# Altium schematic sheet Power_Section_SMPS.SchDoc
size A4; DocumentNumber: 3; SheetNumber: 3; SheetTotal: 8
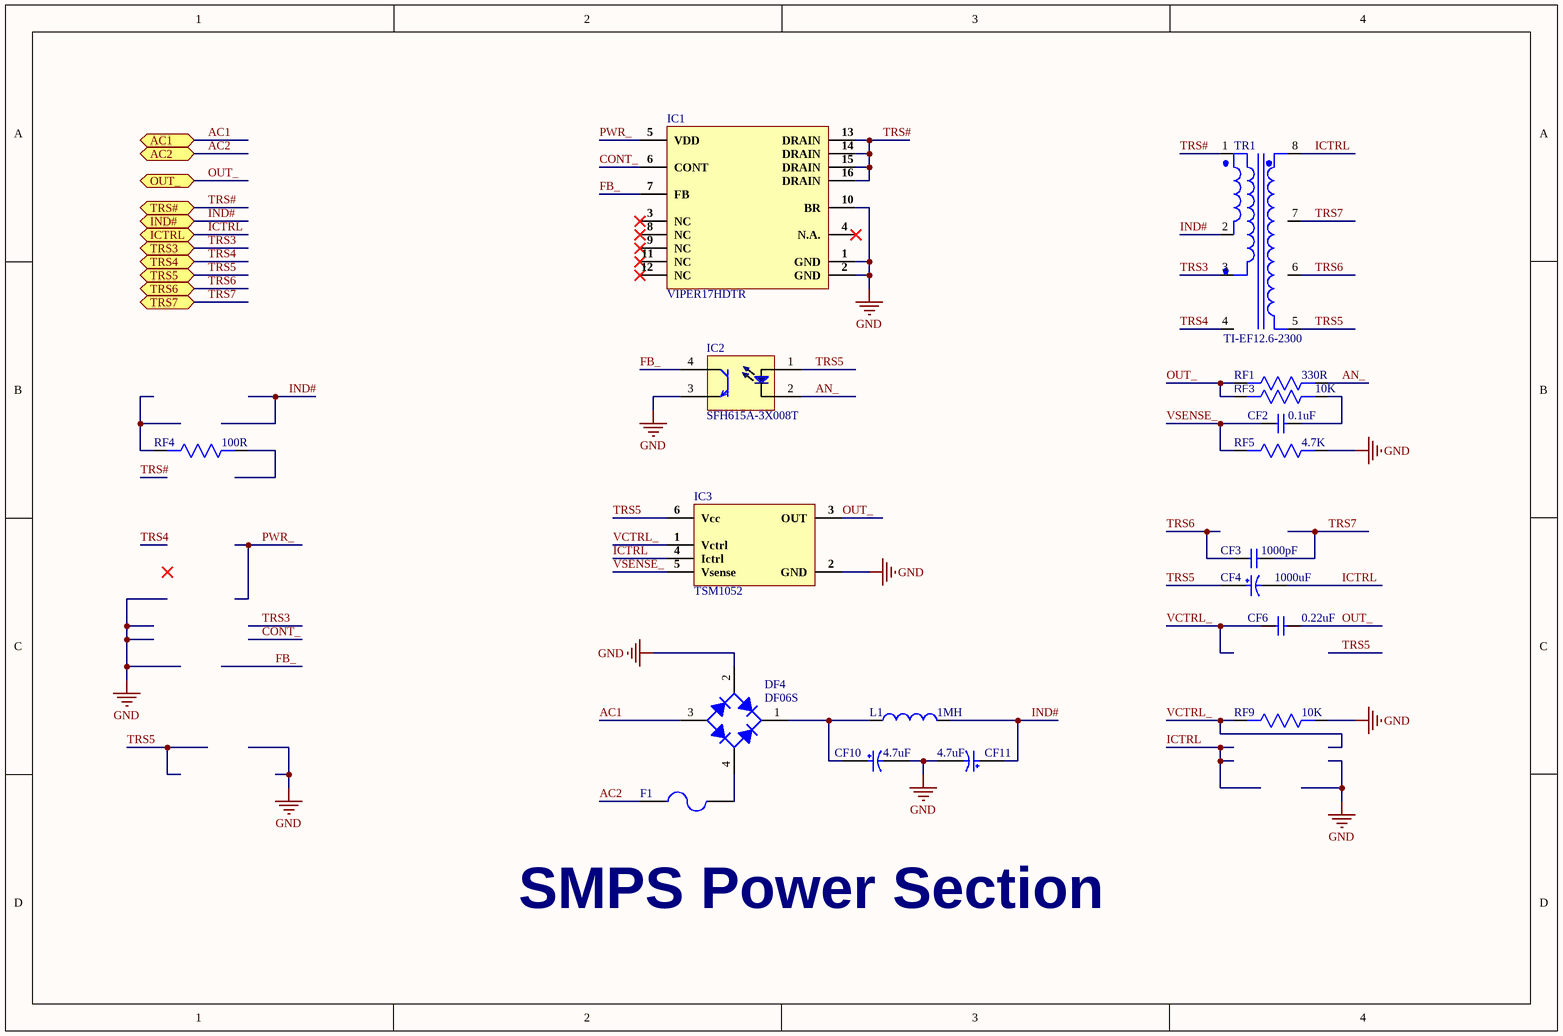
[diagram p0: Power_Section_SMPS.SchDoc]

## Parts
CF2  0.1uF  [Cap0402]
CF3  1000pF  [Cap0402]
CF4  1000uF  [EEE-HA1A102P]
CF6  0.22uF  [Cap0402]
CF10  4.7uF  [ULR2G4R7MNL1GS]
CF11  4.7uF  [ULR2G4R7MNL1GS]
DF4  DF06S  [DF-S]
F1  AF2-1.50V125TM  [AF2-1.50V125TM]  (value not drawn)
IC1  VIPER17HDTR  [16-SO]
IC2  SFH615A-3X008T  [SFH615A-3X008T]
IC3  TSM1052  [SOT-23-6]
L1  1MH  [SDR1307-102KL]
RF1  330R  [RES 0805]
RF3  10K  [RES0805]
RF4  100R  [Res1206]
RF5  4.7K  [RES 0805]
RF9  10K  [Res0603]
TR1  TI-EF12.6-2300  [TI-EF12.6-2300]

## Ports
AC1 (bidir), AC2 (bidir), ICTRL (bidir), IND# (bidir), OUT_ (bidir), TRS3 (bidir), TRS4 (bidir), TRS5 (bidir), TRS6 (bidir), TRS7 (bidir), TRS# (bidir)

## Nets
GND: CF10.2 CF11.2 DF4.2(-) IC1.1(GND) IC1.2(GND) IC1.10(BR) IC2.3(E) IC3.2(GND) RF5.1 RF9.1
AC1: DF4.3 ; port AC1
AC2: F1.1 ; port AC2
AN_: IC2.2(Ca) RF1.1
CONT_: IC1.6(CONT)
FB_: IC1.7(FB) IC2.4(C)
ICTRL: CF4.2 IC3.4(Ictrl) TR1.8 ; port ICTRL
IND#: CF11.1 L1.2 TR1.2 ; port IND#
OUT_: CF6.2 IC3.3(OUT) RF1.2 RF3.2 ; port OUT_
PWR_: IC1.5(VDD)
TRS3: TR1.3 ; port TRS3
TRS4: TR1.4 ; port TRS4
TRS5: CF4.1 IC2.1(An) IC3.6(Vcc) TR1.5 ; port TRS5
TRS6: CF3.1 TR1.6 ; port TRS6
TRS7: CF3.2 TR1.7 ; port TRS7
TRS#: IC1.13(DRAIN) IC1.14(DRAIN) IC1.15(DRAIN) IC1.16(DRAIN) TR1.1 ; port TRS#
VCTRL_: CF6.1 IC3.1(Vctrl) RF9.2
VSENSE_: CF2.1 IC3.5(Vsense) RF5.2
NetCF2_2: CF2.2 RF3.1
NetCF10_1: CF10.1 DF4.1(+) L1.1
NetDF4_4: DF4.4 F1.2

Not connected (* = marked no-connect by the designer): IC1 3(NC)* 4(N.A.)* 8(NC)* 9(NC)* 11(NC)* 12(NC)*; RF4 1 2

## Notes on the sheet
- SMPS Power Section

## Library data of the parts
CF2 = GRM155R71E104KE14J: CAP CER 0.1UF 25V X7R 0402; Manufacturer: Murata; Capacitance: 100nF; Tolerance: 10%; Supplier 1: Digi-Key; Manufacturer Part Number: GRM155R71E104KE14J; Stock 1: 175947; Pricing 1: 1=0.1, 10=0.031, 100=0.0136, 500=0.00974, 1000=0.00765, 2500=0.00696, 5000=0.0064 (USD); Mount: Surface Mount; Case/Package: 0402; Weight: 0.000212oz; Case Code (Imperial): 0402; Case Code (Metric): 1005; Min Operating Temperature: -55°C; Max Operating Temperature: 125°C; Packaging: Tape and Reel; Voltage Rating: 25V; Dielectric: X7R; Termination: SMD/SMT; Composition: Ceramic; Voltage Rating (DC): 25V; Package Quantity: 50000; Length: 0.039inch; Height: 0.5mm; Width: 0.5mm; Thickness: 0.022inch; ComponentLink1URL: http://www.mouser.com/ds/2/281/c02e-2905.pdf?src-supplier=Mouser; ComponentLink1Description: http://www.mouser.com/ds/2/281/c02e-2905.pdf?src-supplier=Mouser; ComponentLink2URL: http://search.murata.co.jp/Ceramy/image/img/A01X/G101/ENG/GRM155R71E104KE14-01.pdf?src-supplier=Digi-Key; ComponentLink2Description: http://search.murata.co.jp/Ceramy/image/img/A01X/G101/ENG/GRM155R71E104KE14-01.pdf?src-supplier=Digi-Key; Supplier Part Number 1: 490-14603-1-ND
CF3 = C0402C102K5RACTU: CAP CER 1000PF 50V X7R 0402; Manufacturer: KEMET; Dielectric Material: Ceramic; Capacitance: 1nF; Tolerance: 10%; Dissipation Factor: 2.5%; Supplier 1: Digi-Key; Manufacturer Part Number: C0402C102K5RACTU; Stock 1: 1339158; Pricing 1: 1=0.1, 10=0.022, 100=0.0099, 500=0.00708, 1000=0.00557, 2500=0.00506, 5000=0.00466 (USD); Mount: Surface Mount,PCB; Case/Package: 0402; Number of Pins: 2; Case Code (Metric): 1005; Case Code (Imperial): 0402; Min Operating Temperature: -55°C; Max Operating Temperature: 125°C; Packaging: Tape and Reel; Voltage Rating (DC): 50V; Dielectric: X7R; Package Quantity: 10000; Voltage Rating: 50V; Termination: SMD/SMT; Voltage: 50V; Length: 1mm; Height: 0.5mm; Width: 0.5mm; Thickness: 0.022inch; Lead Pitch: 0.3mm; Depth: 0.5mm; Radiation Hardening: No; REACH SVHC: No SVHC; ComponentLink1URL: http://www.onlinecomponents.com/productFiles/mf-KEM/docfinderpartnumberc0402c102k5ractu.pdf?src-supplier=Onlinecomponents.com; ComponentLink1Description: http://www.onlinecomponents.com/productFiles/mf-KEM/docfinderpartnumberc0402c102k5ractu.pdf?src-supplier=Onlinecomponents.com; ComponentLink2URL: http://www.alliedelec.com/m/d/9bfe7773041ffe9d406e68bc7b377fdd.pdf?src-supplier=Allied+Electronics; ComponentLink2Description: http://www.alliedelec.com/m/d/9bfe7773041ffe9d406e68bc7b377fdd.pdf?src-supplier=Allied+Electronics; ComponentLink3URL: http://www.farnell.com/datasheets/2740642.pdf?src-supplier=Element14; ComponentLink3Description: http://www.farnell.com/datasheets/2740642.pdf?src-supplier=Element14; ComponentLink4URL: http://www.kemet.com/kemet/web/homepage/kechome.nsf/vapubfiles/KEM_C1002_X7R_SMD.pdf/$file/KEM_C1002_X7R_SMD.pdf?src-supplier=Farnell; ComponentLink4Description: http://www.kemet.com/kemet/web/homepage/kechome.nsf/vapubfiles/KEM_C1002_X7R_SMD.pdf/$file/KEM_C1002_X7R_SMD.pdf?src-supplier=Farnell; ComponentLink5URL: http://www.farnell.com/datasheets/1918693.pdf?src-supplier=Element14; ComponentLink5Description: http://www.farnell.com/datasheets/1918693.pdf?src-supplier=Element14; ComponentLink6URL: http://www.mouser.com/ds/2/212/KEM_C1002_X7R_SMD-1102033.pdf?src-supplier=Mouser; ComponentLink6Description: http://www.mouser.com/ds/2/212/KEM_C1002_X7R_SMD-1102033.pdf?src-supplier=Mouser; Supplier Part Number 1: 399-1032-1-ND
CF4 = EEE-HA1A102P: CAP ALUM 1000UF 20% 10V SMD; Manufacturer: Panasonic; Capacitance: 1mF; Ripple Current: 400mA; Polarity: Polar; Life (Hours): 1000Hour; Lead Diameter: 0.9mm; Supplier 1: Digi-Key; Manufacturer Part Number: EEE-HA1A102P; Stock 1: 7455; Pricing 1: 1=0.68, 10=0.502, 50=0.4014, 100=0.344 (USD); Mount: Surface Mount,PCB; Case/Package: Radial; Contact Plating: Tin; Min Operating Temperature: -40°C; Max Operating Temperature: 105°C; Tolerance: 20%; Voltage Rating: 10V; Packaging: Tape and Reel; Package Quantity: 500; Ripple Current (AC): 400mA; Voltage Rating (DC): 10V; Termination: SMD/SMT; Voltage: 10V; Diameter: 10mm; Length: 10.5mm; Height: 10.2mm; Lead Pitch: 4.6mm; Height - Seated (Max): 0.402inch; Width: 900um; Radiation Hardening: No; REACH SVHC: No SVHC; Lead Free: Lead Free; ComponentLink1URL: https://industrial.panasonic.com/cdbs/www-data/pdf/RDE0000/ABA0000C1151.pdf?src-supplier=Digi-Key; ComponentLink1Description: https://industrial.panasonic.com/cdbs/www-data/pdf/RDE0000/ABA0000C1151.pdf?src-supplier=Digi-Key; ComponentLink2URL: http://www.farnell.com/datasheets/1446029.pdf?src-supplier=Farnell; ComponentLink2Description: http://www.farnell.com/datasheets/1446029.pdf?src-supplier=Farnell; ComponentLink3URL: https://www.alliedelec.com/m/d/7ecf71cebe655f70ab90926cc286bede.pdf?src-supplier=Allied+Electronics; ComponentLink3Description: https://www.alliedelec.com/m/d/7ecf71cebe655f70ab90926cc286bede.pdf?src-supplier=Allied+Electronics; ComponentLink4URL: http://industrial.panasonic.com/www-data/pdf/ABA0000/ABA0000CE3.pdf?src-supplier=Future+Electronics; ComponentLink4Description: http://industrial.panasonic.com/www-data/pdf/ABA0000/ABA0000CE3.pdf?src-supplier=Future+Electronics; ComponentLink5URL: http://www.mouser.com/ds/2/315/ABA0000C1151-947454.pdf?src-supplier=Mouser; ComponentLink5Description: http://www.mouser.com/ds/2/315/ABA0000C1151-947454.pdf?src-supplier=Mouser; ComponentLink6URL: http://industrial.panasonic.com/www-data/pdf/ABA0000/ABA0000CE3.pdf?src-supplier=Avnet; ComponentLink6Description: http://industrial.panasonic.com/www-data/pdf/ABA0000/ABA0000CE3.pdf?src-supplier=Avnet; ComponentLink7URL: http://uk.rs-online.com/webdocs/102e/0900766b8102e3f9.pdf?src-supplier=RSComponents; ComponentLink7Description: http://uk.rs-online.com/webdocs/102e/0900766b8102e3f9.pdf?src-supplier=RSComponents; ComponentLink8URL: http://www.farnell.com/datasheets/1446029.pdf?src-supplier=Element14; ComponentLink8Description: http://www.farnell.com/datasheets/1446029.pdf?src-supplier=Element14; Supplier Part Number 1: PCE4170CT-ND
CF6 = CC0402ZRY5V7BB224: CAP CER 0.22UF 16V Y5V 0402; Manufacturer: Yageo; Capacitance: 220nF; Tolerance: 80%; Supplier 1: Digi-Key; Manufacturer Part Number: CC0402ZRY5V7BB224; Stock 1: 177873; Pricing 1: 1=0.1, 10=0.073, 100=0.0327, 500=0.02336, 1000=0.01836, 2500=0.01669, 5000=0.01536 (USD); Mount: Surface Mount; Case/Package: 0402; Number of Pins: 2; Weight: 2.3E-05oz; Case Code (Imperial): 0402; Case Code (Metric): 1005; Min Operating Temperature: -30°C; Max Operating Temperature: 85°C; Voltage Rating: 16V; Voltage Rating (DC): 16V; Packaging: Tape and Reel; Package Quantity: 1; Dielectric: Y5V; Termination: SMD/SMT; Composition: Ceramic; Length: 1mm; Width: 0.5mm; Thickness: 0.022inch; Depth: 0.5mm; Lead Free: Lead Free; Halogen Free: Halogen Free; ComponentLink1URL: http://www.yageo.com/documents/recent/UPY-GPHC_Y5V_6.3V-to-50V_8.pdf?src-supplier=Digi-Key; ComponentLink1Description: http://www.yageo.com/documents/recent/UPY-GPHC_Y5V_6.3V-to-50V_8.pdf?src-supplier=Digi-Key; ComponentLink2URL: http://media.digikey.com/pdf/Data%20Sheets/Yageo%20PDFs/MLCC%20ordering%20code.pdf?src-supplier=Digi-Key; ComponentLink2Description: http://media.digikey.com/pdf/Data%20Sheets/Yageo%20PDFs/MLCC%20ordering%20code.pdf?src-supplier=Digi-Key; Supplier Part Number 1: 311-1350-1-ND
CF10 CF11 = ULR2G4R7MNL1GS: CAP ALUM 4.7UF 20% 400V SMD; Manufacturer: Nichicon; Ripple Current: 35mA; Leakage Current: 100uA; Life (Hours): 3000Hour; Dissipation Factor: 0.25%; Supplier 1: Digi-Key; Manufacturer Part Number: ULR2G4R7MNL1GS; Stock 1: 114879; Pricing 1: 1=0.84, 10=0.636, 100=0.4549 (USD); Mount: Surface Mount; Case/Package: SMD/SMT; Min Operating Temperature: -40°C; Max Operating Temperature: 105°C; Voltage Rating (DC): 400V; Tolerance: 20%; Capacitance: 4.7uF; Packaging: Tape and Reel; Package Quantity: 500; Termination: SMD/SMT; Voltage Rating: 400V; Voltage: 400V; Diameter: 10mm; Length: 10mm; Height: 10mm; Height - Seated (Max): 0.433inch; Lead Pitch: 4.5mm; Lead Free: Lead Free; ComponentLink1URL: http://www.nichicon.co.jp/english/products/pdfs/e-ch_ref.pdf?src-supplier=Digi-Key; ComponentLink1Description: http://www.nichicon.co.jp/english/products/pdfs/e-ch_ref.pdf?src-supplier=Digi-Key; ComponentLink2URL: http://nichicon-us.com/english/products/pdfs/e-ulr.pdf?src-supplier=Digi-Key; ComponentLink2Description: http://nichicon-us.com/english/products/pdfs/e-ulr.pdf?src-supplier=Digi-Key; Supplier Part Number 1: 493-6709-1-ND
DF4 = DF06S: BRIDGE RECT 1PHASE 600V 1A DF-S; Manufacturer: ON Semiconductor / Fairchild; Forward Voltage: 1.1V; Peak Reverse Current: 5uA; Peak Non-Repetitive Surge Current: 50A; Element Configuration: Single; Number of Elements: 1; Forward Current: 1.5A; Capacitance: 1nF; Max Reverse Leakage Current: 50uA; Tolerance: 5%; Voltage Rating: 100V; Power Dissipation: 3.1W; Supplier 1: Digi-Key; Manufacturer Part Number: DF06S; Stock 1: 3050; Pricing 1: 1=0.5, 10=0.425, 25=0.3964, 100=0.2946, 500=0.23 (USD); Mount: Through Hole; Case/Package: SMD/SMT; Number of Pins: 4; Weight: 0.484g; Case Code (Metric): 1608; Case Code (Imperial): 0603; Min Operating Temperature: -55°C; Max Operating Temperature: 150°C; Packaging: Tape and Reel; Max Repetitive Reverse Voltage (Vrrm): 600V; Max Surge Current: 50A; Package Quantity: 10000; Current Rating: 1.5A; Voltage Rating (DC): 600V; Output Current: 1.5A; Max Forward Surge Current (Ifsm): 50A; Average Rectified Current: 1.5A; Termination: SMD/SMT; Max Power Dissipation: 3.1W; Length: 0.063inch; Height: 3.3mm; Width: 6.5mm; Thickness: 0.035inch; Radiation Hardening: No; Lead Free: Lead Free; REACH SVHC: No SVHC; ComponentLink1URL: http://www.farnell.com/datasheets/2161293.pdf?src-supplier=Element14; ComponentLink1Description: http://www.farnell.com/datasheets/2161293.pdf?src-supplier=Element14; ComponentLink2URL: https://www.fairchildsemi.com/datasheets/DF/DF08S.pdf?src-supplier=Avnet; ComponentLink2Description: https://www.fairchildsemi.com/datasheets/DF/DF08S.pdf?src-supplier=Avnet; ComponentLink3URL: http://www.fairchildsemi.com/ds/DF/DF08S.pdf?src-supplier=Avnet+Europe; ComponentLink3Description: http://www.fairchildsemi.com/ds/DF/DF08S.pdf?src-supplier=Avnet+Europe; ComponentLink4URL: http://www.fairchildsemi.com/ds/DF/DF06S.pdf?src-supplier=Future+Electronics; ComponentLink4Description: http://www.fairchildsemi.com/ds/DF/DF06S.pdf?src-supplier=Future+Electronics; ComponentLink5URL: https://www.fairchildsemi.com/datasheets/DF/DF005S.pdf?src-supplier=Digi-Key; ComponentLink5Description: https://www.fairchildsemi.com/datasheets/DF/DF005S.pdf?src-supplier=Digi-Key; ComponentLink6URL: http://www.mouser.com/ds/2/149/DF06S-190284.pdf?src-supplier=Mouser; ComponentLink6Description: http://www.mouser.com/ds/2/149/DF06S-190284.pdf?src-supplier=Mouser; ComponentLink7URL: http://datasheet.iiic.cc/fairchild/DF06S.pdf?src-supplier=IIIC; ComponentLink7Description: http://datasheet.iiic.cc/fairchild/DF06S.pdf?src-supplier=IIIC; Supplier Part Number 1: DF06SCT-ND
F1 = AF2-1.50V125TM: Chip Fuse Fast Blow 1.5A 62mΩ 100A AC，50A AC，50A DC 1.19 2410 Surface Mount Fuses RoHS; Manufacturer: AEM; Manufacturer Part No: AF2-1.50V125TM; Package: 2410; Value: *
IC1 = VIPER17HDTR: IC OFFLINE CONV PWM OVP 16SOIC; Manufacturer: STMicroelectronics; Output Voltage: 800V; Min Supply Voltage: 8.5V; Max Supply Voltage: 23.5V; Output Current: 420mA; Output Power: 10W; Switching Frequency: 115kHz; Max Duty Cycle: 80%; Operating Supply Current: 1.8mA; Number of Outputs: 1; Isolation: Isolated; Max Power Dissipation: 12W; Topology: Flyback; Supplier 1: Digi-Key; Manufacturer Part Number: VIPER17HDTR; Stock 1: 1628; Pricing 1: 1=1.1, 10=0.98, 25=0.93, 100=0.714, 250=0.631, 500=0.5978, 1000=0.46495 (USD); Mount: Surface Mount; Case/Package: SOIC; Number of Pins: 16; Weight: 0.023492oz; Min Operating Temperature: -40°C; Max Operating Temperature: 150°C; Packaging: Tape and Reel; Package Quantity: 1; Breakdown Voltage: 800V; Length: 9.9mm; Height: 1.47mm; Width: 3.9mm; Radiation Hardening: No; Lead Free: Lead Free; ComponentLink1URL: http://uk.rs-online.com/webdocs/0dbf/0900766b80dbfd31.pdf?src-supplier=RSComponents; ComponentLink1Description: http://uk.rs-online.com/webdocs/0dbf/0900766b80dbfd31.pdf?src-supplier=RSComponents; ComponentLink2URL: http://www.st.com/web/en/resource/technical/document/datasheet/CD00185039.pdf?src-supplier=Avnet+Europe; ComponentLink2Description: http://www.st.com/web/en/resource/technical/document/datasheet/CD00185039.pdf?src-supplier=Avnet+Europe; ComponentLink3URL: http://www.st.com/content/ccc/resource/technical/document/datasheet/be/0b/b1/be/53/ef/4f/78/CD00185039.pdf/files/CD00185039.pdf/_jcr_content/translations/en.CD00185039.pdf?src-supplier=Digi-Key; ComponentLink3Description: http://www.st.com/content/ccc/resource/technical/document/datasheet/be/0b/b1/be/53/ef/4f/78/CD00185039.pdf/files/CD00185039.pdf/_jcr_content/translations/en.CD00185039.pdf?src-supplier=Digi-Key; ComponentLink4URL: https://www.verical.com/server-webapp/html/getDatasheet?partID=189260&src-supplier=Verical; ComponentLink4Description: https://www.verical.com/server-webapp/html/getDatasheet?partID=189260&src-supplier=Verical; Supplier Part Number 1: 497-7045-1-ND
IC2 = SFH615A-3X008T: OPTOISOLATOR 5.3KV TRANS 4SMD
IC3 = TSM1052: IC CONTROLLER CC/CV SMPS SOT23-6; Manufacturer: STMicroelectronics; Output Voltage: 18V; Output Current: 100mA; Min Supply Voltage: 1.7V; Quiescent Current: 150A; Reference Voltage: 1.234V; Supplier 1: Digi-Key; Manufacturer Part Number: TSM1052; Stock 1: 1632; Pricing 1: 1=0.68, 10=0.594, 25=0.558, 100=0.423, 250=0.36, 500=0.342, 1000=0.261 (USD); Mount: Surface Mount; Case/Package: SOT-23; Number of Pins: 6; Weight: 0.00709oz; Min Operating Temperature: -10°C; Max Operating Temperature: 85°C; Packaging: Tape and Reel; Package Quantity: 3000; Max Supply Voltage: 18V; Voltage Rating: 18V; Length: 3.05mm; Height: 1.3mm; Width: 1.75mm; Radiation Hardening: No; Lead Free: Lead Free; REACH SVHC: No SVHC; ComponentLink1URL: http://www.st.com/web/en/resource/technical/document/datasheet/CD00152575.pdf?src-supplier=Digi-Key; ComponentLink1Description: http://www.st.com/web/en/resource/technical/document/datasheet/CD00152575.pdf?src-supplier=Digi-Key; ComponentLink2URL: http://www.farnell.com/datasheets/1700292.pdf?src-supplier=Element14; ComponentLink2Description: http://www.farnell.com/datasheets/1700292.pdf?src-supplier=Element14; ComponentLink3URL: http://www.st.com/content/ccc/resource/technical/document/datasheet/a6/0f/5c/80/87/ac/4b/ec/CD00152575.pdf/files/CD00152575.pdf/jcr:content/translations/en.CD00152575.pdf?src-supplier=Digi-Key; ComponentLink3Description: http://www.st.com/content/ccc/resource/technical/document/datasheet/a6/0f/5c/80/87/ac/4b/ec/CD00152575.pdf/files/CD00152575.pdf/jcr:content/translations/en.CD00152575.pdf?src-supplier=Digi-Key; ComponentLink4URL: http://www.mouser.com/ds/2/389/tsm1052-974404.pdf?src-supplier=Mouser; ComponentLink4Description: http://www.mouser.com/ds/2/389/tsm1052-974404.pdf?src-supplier=Mouser; ComponentLink5URL: http://datasheet.iiic.cc/stmicroelectronics/TSM1052.pdf?src-supplier=IIIC; ComponentLink5Description: http://datasheet.iiic.cc/stmicroelectronics/TSM1052.pdf?src-supplier=IIIC; Supplier Part Number 1: 497-6034-1-ND
L1 = SDR1307-102KL: FIXED IND 1MH 650MA 1.6 OHM SMD; Manufacturer: Bourns; Core Material: Ferrite; Tolerance: 10%; DC Resistance (DCR): 1.6R; Saturation Current: 1A; Shielding: Unshielded; Q Factor: 10; Self Resonant Frequency: 1.4MHz; Test Frequency: 100kHz; Supplier 1: Digi-Key; Manufacturer Part Number: SDR1307-102KL; Stock 1: 12475; Pricing 1: 1=1.05, 10=0.972, 100=0.7027 (USD); Mount: Surface Mount; Case/Package: Nonstandard; Min Operating Temperature: -40°C; Max Operating Temperature: 125°C; Inductance: 1mH; Max DC Current: 650mA; Package Quantity: 400; Current Rating: 650mA; Packaging: Tape and Reel; Inductance Tolerance: 10%; Composition: Wirewound; Termination: SMD/SMT; RMS Current (Irms): 650mA; DC Current: 650mA; Military Standard: Not; Length: 0.512inch; Height: 0.1mm; Width: 0.512inch; Height - Seated (Max): 0.288inch; Radiation Hardening: No; REACH SVHC: No SVHC; ComponentLink1URL: http://www.bourns.com/docs/Product-Datasheets/SDR1307.pdf?src-supplier=Digi-Key; ComponentLink1Description: http://www.bourns.com/docs/Product-Datasheets/SDR1307.pdf?src-supplier=Digi-Key; ComponentLink2URL: http://www.bourns.com/data/global/pdfs/SDR1307.pdf?src-supplier=Avnet+Europe; ComponentLink2Description: http://www.bourns.com/data/global/pdfs/SDR1307.pdf?src-supplier=Avnet+Europe; ComponentLink3URL: http://www.bourns.com/data/global/pdfs/SDR1307.pdf?src-supplier=Avnet; ComponentLink3Description: http://www.bourns.com/data/global/pdfs/SDR1307.pdf?src-supplier=Avnet; Supplier Part Number 1: SDR1307-102KLCT-ND
RF1 = ERJ-P06J331V: RES SMD 330 OHM 5% 1/2W 0805
RF3 = ERJ-P06J103V: RES SMD 10K OHM 5% 1/2W 0805; Manufacturer: Panasonic; Power Rating: 500mW; Voltage Rating: 400V; Temperature Coefficient: 200ppm/°C; Voltage Rating (DC): 150V; ComponentLink1URL: https://www.verical.com/server-webapp/html/getDatasheet?partID=409513; ComponentLink1Description: https://www.verical.com/server-webapp/html/getDatasheet?partID=409513; ComponentLink2URL: http://components.arrow.com/part/dataview/44988207S7163511N1174; ComponentLink2Description: http://components.arrow.com/part/dataview/44988207S7163511N1174; ComponentLink3URL: https://www.seielect.com/Catalog/SEI-RMCF_RMCP.pdf; ComponentLink3Description: https://www.seielect.com/Catalog/SEI-RMCF_RMCP.pdf; ComponentLink4URL: http://www.seielect.com/catalog/sei-rmc.pdf; ComponentLink4Description: http://www.seielect.com/catalog/sei-rmc.pdf; ComponentLink5URL: https://datasheet.ciiva.com/7777/424479-7777391.pdf; ComponentLink5Description: https://datasheet.ciiva.com/7777/424479-7777391.pdf; ComponentLink6URL: https://datasheet.ciiva.com/2581/crcwhpe3-2581488.pdf; ComponentLink6Description: https://datasheet.ciiva.com/2581/crcwhpe3-2581488.pdf; ComponentLink7URL: https://datasheet.ciiva.com/11808/0900766b80d98b26-11808546.pdf; ComponentLink7Description: https://datasheet.ciiva.com/11808/0900766b80d98b26-11808546.pdf; ComponentLink8URL: https://datasheet.ciiva.com/8934/dcrcwe3-8934585.pdf; ComponentLink8Description: https://datasheet.ciiva.com/8934/dcrcwe3-8934585.pdf; ComponentLink9URL: https://datasheet.ciiva.com/2467/dcrcwe3-2467241.pdf; ComponentLink9Description: https://datasheet.ciiva.com/2467/dcrcwe3-2467241.pdf; ComponentLink10URL: https://datasheet.ciiva.com/7777/1697337-7777401.pdf; ComponentLink10Description: https://datasheet.ciiva.com/7777/1697337-7777401.pdf; ComponentLink11URL: https://datasheet.ciiva.com/16852/dcrcwe3-16852347.pdf; ComponentLink11Description: https://datasheet.ciiva.com/16852/dcrcwe3-16852347.pdf; ComponentLink12URL: https://datasheet.ciiva.com/16200/dcrcwe3-16200123.pdf; ComponentLink12Description: https://datasheet.ciiva.com/16200/dcrcwe3-16200123.pdf; ComponentLink13URL: https://datasheet.ciiva.com/16725/70201119-16725227.pdf; ComponentLink13Description: https://datasheet.ciiva.com/16725/70201119-16725227.pdf; ComponentLink14URL: https://datasheet.ciiva.com/2467/dcrcwe3-2467239.pdf; ComponentLink14Description: https://datasheet.ciiva.com/2467/dcrcwe3-2467239.pdf; ComponentLink15URL: https://datasheet.ciiva.com/7777/1720486-7777575.pdf; ComponentLink15Description: https://datasheet.ciiva.com/7777/1720486-7777575.pdf; ComponentLink16URL: https://datasheet.ciiva.com/8934/dcrcwe3-8934581.pdf; ComponentLink16Description: https://datasheet.ciiva.com/8934/dcrcwe3-8934581.pdf; ComponentLink17URL: https://datasheet.ciiva.com/2467/dcrcwe3-2467240.pdf; ComponentLink17Description: https://datasheet.ciiva.com/2467/dcrcwe3-2467240.pdf; ComponentLink18URL: https://datasheet.ciiva.com/7777/1720486-7777576.pdf; ComponentLink18Description: https://datasheet.ciiva.com/7777/1720486-7777576.pdf; ComponentLink19URL: https://datasheet.ciiva.com/5546/dcrcwe3-109170-5546983.pdf; ComponentLink19Description: https://datasheet.ciiva.com/5546/dcrcwe3-109170-5546983.pdf; ComponentLink20URL: https://datasheet.ciiva.com/16755/70201119-16755757.pdf; ComponentLink20Description: https://datasheet.ciiva.com/16755/70201119-16755757.pdf; ComponentLink21URL: https://datasheet.ciiva.com/3258/dcrcwe3-3258221.pdf; ComponentLink21Description: https://datasheet.ciiva.com/3258/dcrcwe3-3258221.pdf; ComponentLink22URL: https://datasheet.ciiva.com/17204/dcrcwe3-17204398.pdf; ComponentLink22Description: https://datasheet.ciiva.com/17204/dcrcwe3-17204398.pdf; ComponentLink23URL: https://datasheet.ciiva.com/16435/dcrcwe3-16435934.pdf; ComponentLink23Description: https://datasheet.ciiva.com/16435/dcrcwe3-16435934.pdf; ComponentLink24URL: https://datasheet.ciiva.com/46441/1533075-46441628.pdf; ComponentLink24Description: https://datasheet.ciiva.com/46441/1533075-46441628.pdf; ComponentLink25URL: https://datasheet.ciiva.com/5544/dcrcwe3-109170-5544649.pdf; ComponentLink25Description: https://datasheet.ciiva.com/5544/dcrcwe3-109170-5544649.pdf; ComponentLink26URL: https://datasheet.ciiva.com/8337/dcrcwe3-8337669.pdf; ComponentLink26Description: https://datasheet.ciiva.com/8337/dcrcwe3-8337669.pdf; ComponentLink27URL: https://datasheet.ciiva.com/2463/dcrcwe3-2463179.pdf; ComponentLink27Description: https://datasheet.ciiva.com/2463/dcrcwe3-2463179.pdf; ComponentLink28URL: https://datasheet.ciiva.com/2463/dcrcwe3-2463178.pdf; ComponentLink28Description: https://datasheet.ciiva.com/2463/dcrcwe3-2463178.pdf; ComponentLink29URL: https://datasheet.ciiva.com/2474/crcwhpe3-2474640.pdf; ComponentLink29Description: https://datasheet.ciiva.com/2474/crcwhpe3-2474640.pdf; ComponentLink30URL: https://datasheet.ciiva.com/48527/crcwhpe3-48527638.pdf; ComponentLink30Description: https://datasheet.ciiva.com/48527/crcwhpe3-48527638.pdf; ComponentLink31URL: https://datasheet.ciiva.com/5547/crcwhpe3-46056-5547896.pdf; ComponentLink31Description: https://datasheet.ciiva.com/5547/crcwhpe3-46056-5547896.pdf; ComponentLink32URL: https://datasheet.ciiva.com/9112/crcwhpe3-9112140.pdf; ComponentLink32Description: https://datasheet.ciiva.com/9112/crcwhpe3-9112140.pdf; ComponentLink33URL: https://datasheet.ciiva.com/2474/crcwhpe3-2474638.pdf; ComponentLink33Description: https://datasheet.ciiva.com/2474/crcwhpe3-2474638.pdf; ComponentLink34URL: https://datasheet.ciiva.com/2474/crcwhpe3-2474639.pdf; ComponentLink34Description: https://datasheet.ciiva.com/2474/crcwhpe3-2474639.pdf; Supplier 1: Digi-Key; Manufacturer Part Number: ERJ-P06J103V; Stock 1: 130484; Pricing 1: 1=0.11, 10=0.103, 100=0.0396, 1000=0.0174, 2500=0.0151 (USD); Mount: Surface Mount; Case/Package: 0805; Weight: 0.000194oz; Case Code (Metric): 2012; Case Code (Imperial): 0805; Contact Plating: Tin; Min Operating Temperature: -55°C; Max Operating Temperature: 155°C; Resistance: 10K; Tolerance: 5%; Packaging: Tape and Reel; Package Quantity: 1; Composition: Thick Film; Number of Terminations: 2; Termination: SMD/SMT; Military Standard: Not; Max Power Dissipation: 500mW; Features: Automotive AEC-Q200; Length: 2mm; Height: 0.6mm; Width: 0.049inch; Depth: 1.25mm; Radiation Hardening: No; REACH SVHC: Unknown; Lead Free: Lead Free; ComponentLink35URL: http://uk.rs-online.com/webdocs/12cb/0900766b812cb812.pdf?src-supplier=RSComponents; ComponentLink35Description: http://uk.rs-online.com/webdocs/12cb/0900766b812cb812.pdf?src-supplier=RSComponents; ComponentLink36URL: http://industrial.panasonic.com/www-data/pdf/AOA0000/AOA0000CE4.pdf?src-supplier=Avnet; ComponentLink36Description: http://industrial.panasonic.com/www-data/pdf/AOA0000/AOA0000CE4.pdf?src-supplier=Avnet; ComponentLink37URL: http://industrial.panasonic.com/www-data/pdf/AOA0000/AOA0000CE4.pdf?src-supplier=Future+Electronics; ComponentLink37Description: http://industrial.panasonic.com/www-data/pdf/AOA0000/AOA0000CE4.pdf?src-supplier=Future+Electronics; ComponentLink38URL: http://www.farnell.com/datasheets/2059624.pdf?src-supplier=Element14; ComponentLink38Description: http://www.farnell.com/datasheets/2059624.pdf?src-supplier=Element14; ComponentLink39URL: https://www.alliedelec.com/m/d/12e4be79354a6c30aae91f11e8182ea0.pdf?src-supplier=Allied+Electronics; ComponentLink39Description: https://www.alliedelec.com/m/d/12e4be79354a6c30aae91f11e8182ea0.pdf?src-supplier=Allied+Electronics; ComponentLink40URL: http://www.farnell.com/datasheets/2059624.pdf?src-supplier=Farnell; ComponentLink40Description: http://www.farnell.com/datasheets/2059624.pdf?src-supplier=Farnell; Supplier Part Number 1: P10KADCT-ND
RF4 = RNCP1206FTD100R: RES 100 OHM 1% 1/2W 1206; Manufacturer: Stackpole Electronics; Max Power Dissipation: 500mW; Temperature Coefficient: 100ppm/°C; Supplier 1: Digi-Key; Manufacturer Part Number: RNCP1206FTD100R; Stock 1: 60612; Pricing 1: 1=0.1, 10=0.089, 100=0.0341, 1000=0.015, 2500=0.01296 (USD); Mount: Surface Mount; Case/Package: 1206; Case Code (Metric): 3216; Case Code (Imperial): 1206; Contact Plating: Tin; Min Operating Temperature: -55°C; Max Operating Temperature: 155°C; Resistance: 100R; Tolerance: 1%; Packaging: Tape and Reel; Composition: Thin Film; Number of Terminations: 2; Features: Moisture Resistant,Anti-Sulfur; Length: 0.122inch; Height: 0.024inch; Width: 0.059inch; Radiation Hardening: No; ComponentLink1URL: https://www.seielect.com/catalog/sei-rncp.pdf?src-supplier=Digi-Key; ComponentLink1Description: https://www.seielect.com/catalog/sei-rncp.pdf?src-supplier=Digi-Key; ComponentLink2URL: http://www.seielect.com/Catalog/SEI-rncp.pdf?src-supplier=Avnet; ComponentLink2Description: http://www.seielect.com/Catalog/SEI-rncp.pdf?src-supplier=Avnet; Supplier Part Number 1: RNCP1206FTD100RCT-ND
RF5 = ERJ-P06J472V: RES SMD 4.7K OHM 5% 1/2W 0805; Manufacturer: Panasonic; Resistance: 4.7kR; Temperature Coefficient: 200ppm/°C; Power Rating: 500mW; Voltage Rating: 400V; Voltage Rating (DC): 150V; Supplier 1: Digi-Key; Manufacturer Part Number: ERJ-P06J472V; Stock 1: 52373; Pricing 1: 1=0.11, 10=0.103, 100=0.0396, 1000=0.01742, 2500=0.01505 (USD); Mount: Surface Mount; Case/Package: 0805; Contact Plating: Tin; Case Code (Imperial): 0805; Case Code (Metric): 2012; Min Operating Temperature: -55°C; Max Operating Temperature: 155°C; Tolerance: 5%; Composition: Thick Film; Packaging: Tape and Reel; Package Quantity: 1; Termination: SMD/SMT; Number of Terminations: 2; Military Standard: Not; Max Power Dissipation: 500mW; Features: Automotive AEC-Q200; Length: 2mm; Height: 0.6mm; Width: 1.2mm; Depth: 1.25mm; Radiation Hardening: No; REACH SVHC: Unknown; Lead Free: Lead Free; ComponentLink1URL: http://industrial.panasonic.com/www-data/pdf/AOA0000/AOA0000CE4.pdf?src-supplier=Avnet+Europe; ComponentLink1Description: http://industrial.panasonic.com/www-data/pdf/AOA0000/AOA0000CE4.pdf?src-supplier=Avnet+Europe; ComponentLink2URL: http://uk.rs-online.com/webdocs/12cb/0900766b812cb812.pdf?src-supplier=RSComponents; ComponentLink2Description: http://uk.rs-online.com/webdocs/12cb/0900766b812cb812.pdf?src-supplier=RSComponents; ComponentLink3URL: https://www.alliedelec.com/m/d/12e4be79354a6c30aae91f11e8182ea0.pdf?src-supplier=Allied+Electronics; ComponentLink3Description: https://www.alliedelec.com/m/d/12e4be79354a6c30aae91f11e8182ea0.pdf?src-supplier=Allied+Electronics; ComponentLink4URL: http://www.farnell.com/datasheets/2059624.pdf?src-supplier=Element14; ComponentLink4Description: http://www.farnell.com/datasheets/2059624.pdf?src-supplier=Element14; Supplier Part Number 1: P4.7KADCT-ND
RF9 = CRGH0603J10K: RES SMD 10K OHM 5% 1/5W 0603; Manufacturer: TE Connectivity Holsworthy; Resistance: 10kR; Temperature Coefficient: 100ppm/°C; Power Rating: 200mW; Voltage Rating: 50V; Number of Resistors: 1; Supplier 1: Digi-Key; Manufacturer Part Number: CRGH0603J10K; Stock 1: 55163; Pricing 1: 1=0.1, 10=0.047, 100=0.0192, 1000=0.00861, 2500=0.00748 (USD); Mount: Surface Mount; Case/Package: 0603; Case Code (Imperial): 0603; Case Code (Metric): 1608; Min Operating Temperature: -55°C; Max Operating Temperature: 125°C; Tolerance: 5%; Packaging: Tape and Reel; Composition: Thick Film,Power resistor; Number of Terminations: 2; Termination: Solder; Voltage Rating (DC): 50V; Length: 1.6mm; Height: 0.45mm; Width: 0.8mm; Depth: 0.8mm; REACH SVHC: No SVHC; ELV: Compliant; ComponentLink1URL: http://www.farnell.com/datasheets/2007183.pdf?src-supplier=Element14; ComponentLink1Description: http://www.farnell.com/datasheets/2007183.pdf?src-supplier=Element14; Supplier Part Number 1: A126394CT-ND
TR1 = TI-EF12.6-2300: Transformer: impulse; power supply; 3W; Works with: TNY264; 1.25m; Manufacturer: FERYSTER; Value: Custom; Manufacturer Part No: TI-EF12.6-2300; Package: Custom